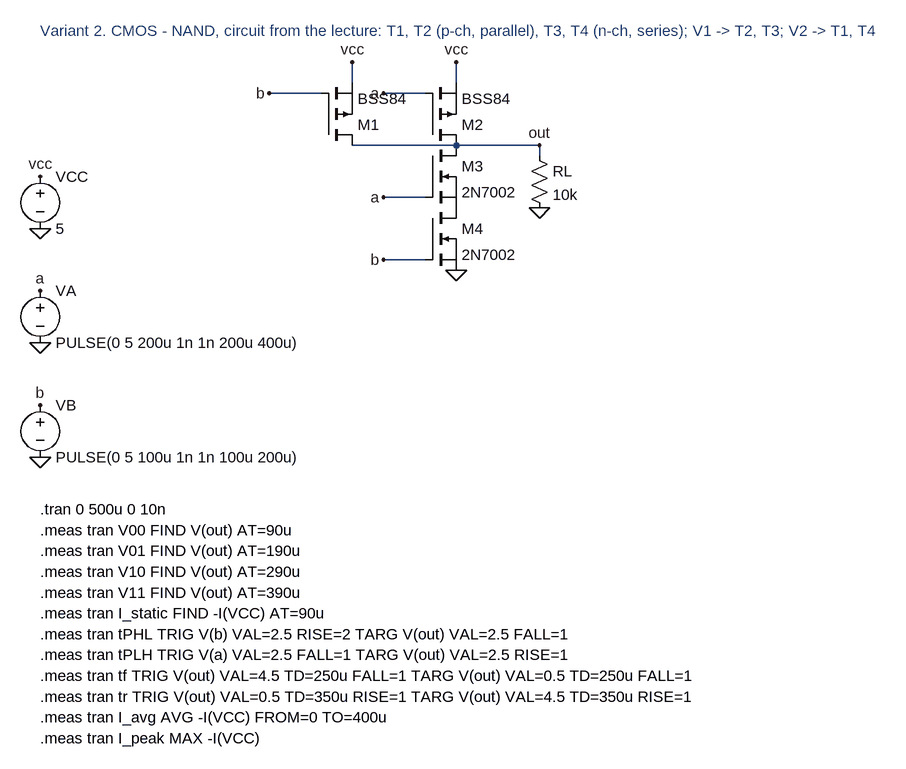
[diagram p0: schematic 5_CMOS_NAND.asc]
5_CMOS_NAND.asc, the LTspice schematic file:
Version 4
SHEET 1 1400 760
SYMBOL voltage -288 32 R0
SYMATTR InstName VCC
SYMATTR Value 5
FLAG -288 48 vcc
FLAG -288 128 0
SYMBOL voltage -288 208 R0
SYMATTR InstName VA
SYMATTR Value PULSE(0 5 200u 1n 1n 200u 400u)
FLAG -288 224 a
FLAG -288 304 0
SYMBOL voltage -288 384 R0
SYMATTR InstName VB
SYMATTR Value PULSE(0 5 100u 1n 1n 100u 200u)
FLAG -288 400 b
FLAG -288 480 0
SYMBOL pmos 144 0 M180
SYMATTR InstName M1
SYMATTR Value BSS84
SYMBOL pmos 304 0 M180
SYMATTR InstName M2
SYMATTR Value BSS84
SYMBOL nmos 304 0 R0
SYMATTR InstName M3
SYMATTR Value 2N7002
SYMBOL nmos 304 96 R0
SYMATTR InstName M4
SYMATTR Value 2N7002
WIRE 192 -96 192 -128
FLAG 192 -128 vcc
WIRE 352 -96 352 -128
FLAG 352 -128 vcc
WIRE 192 0 352 0
WIRE 352 0 480 0
FLAG 480 0 out
SYMBOL res 464 0 R0
SYMATTR InstName RL
SYMATTR Value 10k
WIRE 480 0 480 16
FLAG 480 96 0
FLAG 352 192 0
WIRE 144 -80 64 -80
FLAG 64 -80 b
WIRE 304 -80 240 -80
FLAG 240 -80 a
WIRE 304 80 240 80
FLAG 240 80 a
WIRE 304 176 240 176
FLAG 240 176 b
TEXT -288 -176 Left 2 ;Variant 2. CMOS - NAND, circuit from the lecture: T1, T2 (p-ch, parallel), T3, T4 (n-ch, series); V1 -> T2, T3; V2 -> T1, T4
TEXT -288 560 Left 2 !.tran 0 500u 0 10n
TEXT -288 592 Left 2 !.meas tran V00 FIND V(out) AT=90u
TEXT -288 624 Left 2 !.meas tran V01 FIND V(out) AT=190u
TEXT -288 656 Left 2 !.meas tran V10 FIND V(out) AT=290u
TEXT -288 688 Left 2 !.meas tran V11 FIND V(out) AT=390u
TEXT -288 720 Left 2 !.meas tran I_static FIND -I(VCC) AT=90u
TEXT -288 752 Left 2 !.meas tran tPHL TRIG V(b) VAL=2.5 RISE=2 TARG V(out) VAL=2.5 FALL=1
TEXT -288 784 Left 2 !.meas tran tPLH TRIG V(a) VAL=2.5 FALL=1 TARG V(out) VAL=2.5 RISE=1
TEXT -288 816 Left 2 !.meas tran tf TRIG V(out) VAL=4.5 TD=250u FALL=1 TARG V(out) VAL=0.5 TD=250u FALL=1
TEXT -288 848 Left 2 !.meas tran tr TRIG V(out) VAL=0.5 TD=350u RISE=1 TARG V(out) VAL=4.5 TD=350u RISE=1
TEXT -288 880 Left 2 !.meas tran I_avg AVG -I(VCC) FROM=0 TO=400u
TEXT -288 912 Left 2 !.meas tran I_peak MAX -I(VCC)

The netlist it stands for:
* 5_CMOS_NAND.asc
VCC vcc 0 5
VA a 0 PULSE(0 5 200u 1n 1n 200u 400u)
VB b 0 PULSE(0 5 100u 1n 1n 100u 200u)
M1 out b vcc vcc BSS84
M2 out a vcc vcc BSS84
M3 out a P001 P001 2N7002
M4 P001 b 0 0 2N7002
RL out 0 10k
.model NMOS NMOS
.model PMOS PMOS
.lib standard.mos
* Variant 2. CMOS - NAND, circuit from the lecture: T1, T2 (p-ch, parallel), T3, T4 (n-ch, series); V1 -> T2, T3; V2 -> T1, T4
.tran 0 500u 0 10n
.meas tran V00 FIND V(out) AT=90u
.meas tran V01 FIND V(out) AT=190u
.meas tran V10 FIND V(out) AT=290u
.meas tran V11 FIND V(out) AT=390u
.meas tran I_static FIND -I(VCC) AT=90u
.meas tran tPHL TRIG V(b) VAL=2.5 RISE=2 TARG V(out) VAL=2.5 FALL=1
.meas tran tPLH TRIG V(a) VAL=2.5 FALL=1 TARG V(out) VAL=2.5 RISE=1
.meas tran tf TRIG V(out) VAL=4.5 TD=250u FALL=1 TARG V(out) VAL=0.5 TD=250u FALL=1
.meas tran tr TRIG V(out) VAL=0.5 TD=350u RISE=1 TARG V(out) VAL=4.5 TD=350u RISE=1
.meas tran I_avg AVG -I(VCC) FROM=0 TO=400u
.meas tran I_peak MAX -I(VCC)
.backanno
.end